# Altium schematic sheet DSP大板子.SchDoc (part 2 of 7)
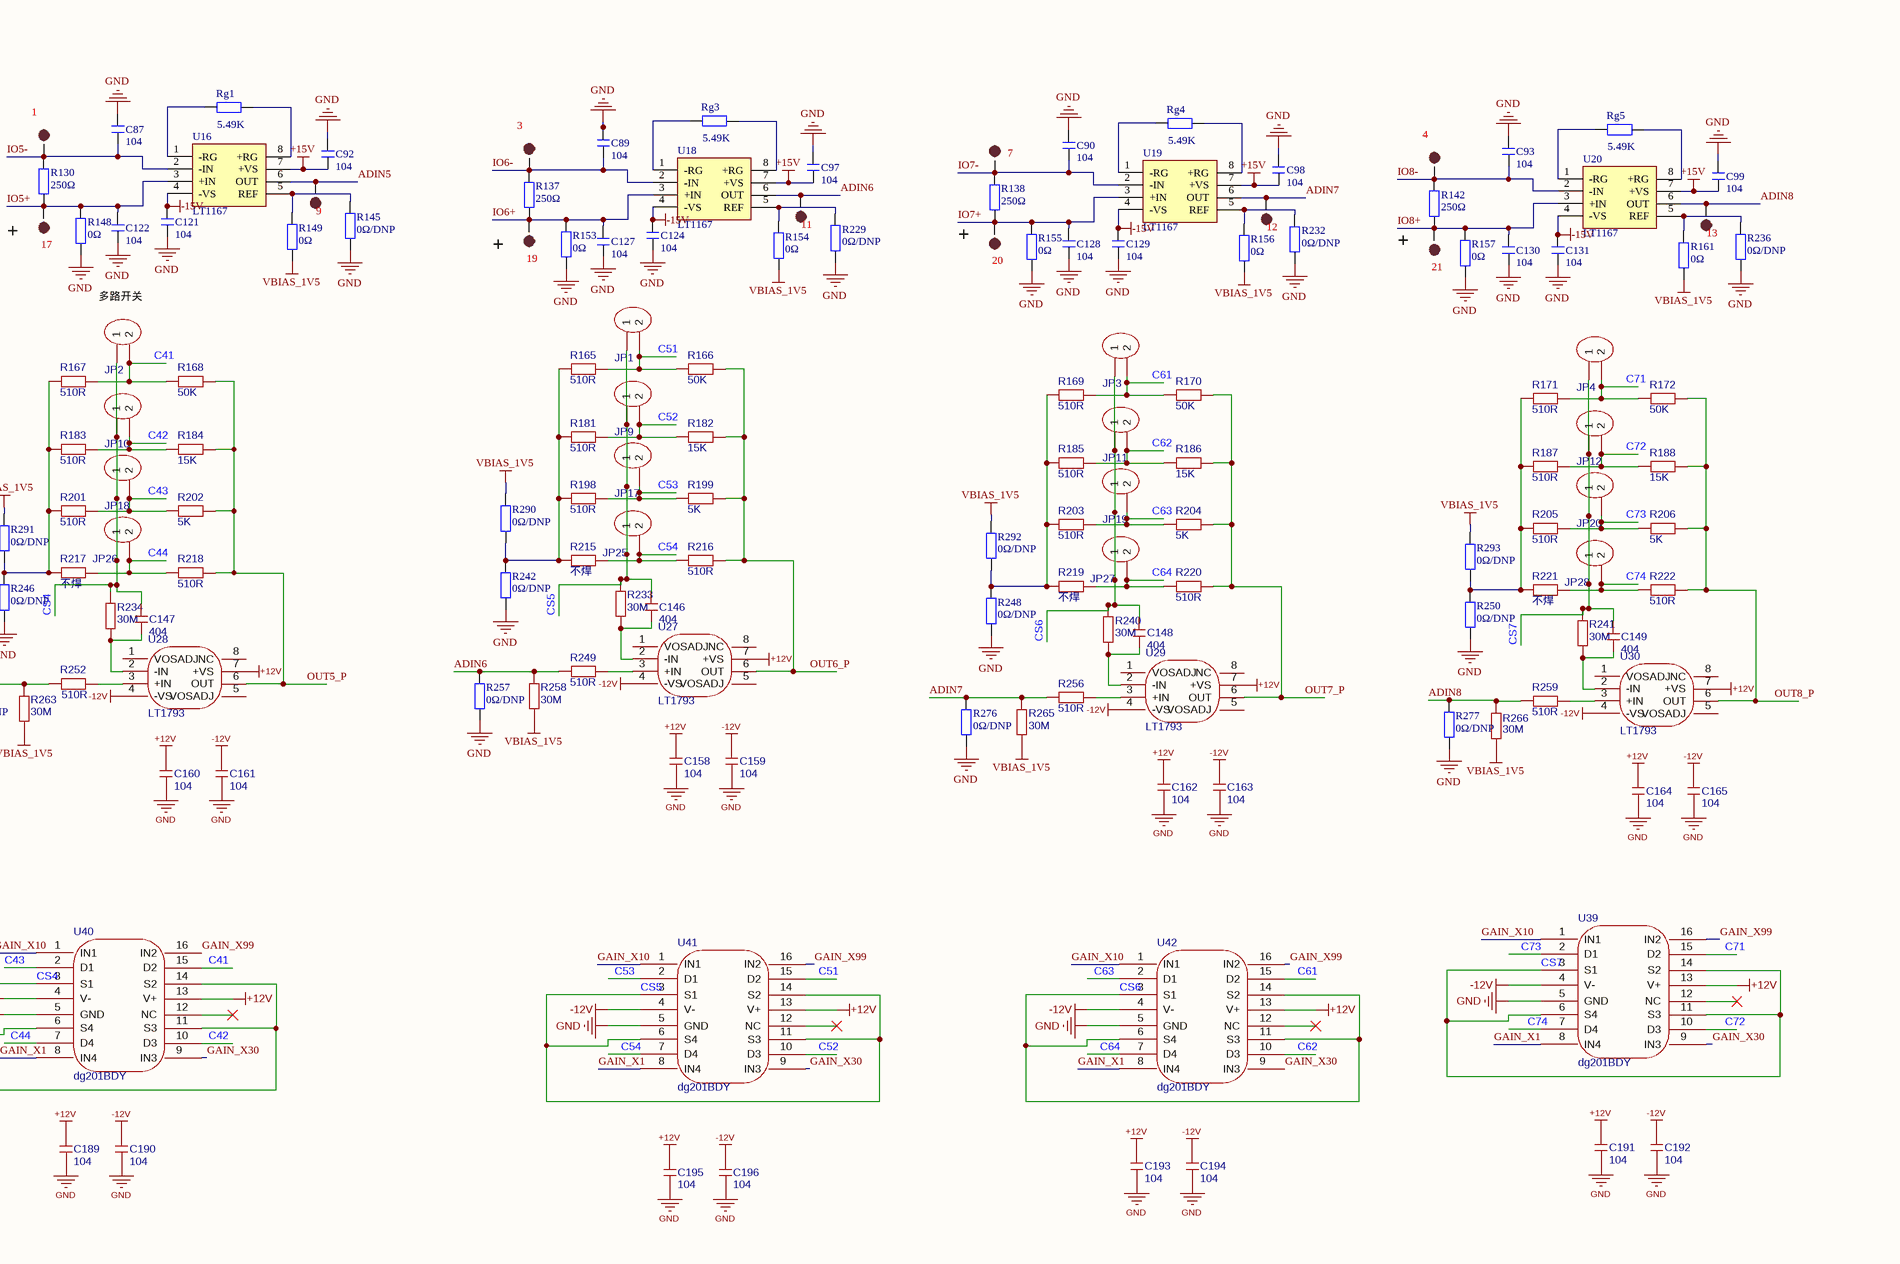
[diagram p6: DSP大板子.SchDoc, bottom right]
## Library data of the parts
1-24 +12 +15 -1 -12 -15 T1 = TEST-POINT: 测试点
BOOT1 = 5BIT DIP SOP Switch: Manufacturer: KE; Manufacturer PartNumber: DSWB05LHGET; Remark: 5位直插拨码开关 红色,2.54mm
C1 C17 C35 C36 C40 C76 C77 C87-C101 C107 C121 C122 C124-C137 = C: 贴片电容; BOM名称: 无极性贴片电容; 淘宝ID: 封装库来自淘宝 ID：黄晶宝石; 联系售后，技术支持: https://shop463601444.taobao.com; 唯一出售店铺网址: https://shop463601444.taobao.com
C2 C4 C5 C7-C9 C11 C13 C14 C16 C18 C19 C21 C26 C28 C30 C31 C34 C38 C39 C45 C46 C49-C51 C60-C62 C64 C66 C68 C71 C78 C79 C81 C86 C108-C111 C117-C119 C139 C143 C145 C154 C155 C157 C175 C180 C197-C200 = C: 无极性贴片电容; 版权归属: 源创客; BOM名称: 无极性贴片电容; 学习资源: www.ooocke.com
C3 C12 C20 C33 C41 C47 C53 C55 C67 = fs32x106k101egg: 容值:10uF;精度:±10%;额定电压:100V;温度系数:X7R;; Manufacturer: PSA(信昌电陶); AddInBom: yes; ModelId: 833068e7fe044595a6eec77c56179455; ModelName: C1210_L3.2-W2.5-H2.5; ModelTransform: 125.984,98.425,0,0,0,0,0,0,0; Tolerance: ±10%; Voltage Rating: 100V; Temperature Coefficient: X7R; Symbol: FS32X106K101EGG; LCSC Part Name: 10uF ±10% 100V; SupplierPart: C5156756; ManufacturerPart: FS32X106K101EGG; Supplier Footprint: 1210; JLCPCB Part Class: Extended Part; Datasheet: https://item.szlcsc.com/datasheet/FS32X106K101EGG/5791227.html; Supplier: LCSC; ConvertToPcb: yes; FootprintName: C1210; Value: 10uF
C6 C15 C25 C37 C44 C48 C59 C70 = fs32x106k101egg: 容值:10uF;精度:±10%;额定电压:100V;温度系数:X7R;; Manufacturer: PSA(信昌电陶); AddInBom: yes; ModelId: 833068e7fe044595a6eec77c56179455; ModelName: C1210_L3.2-W2.5-H2.5; ModelTransform: 125.984,98.425,0,0,0,0,0,0,0; Value: 10uF; Tolerance: ±10%; Voltage Rating: 100V; Temperature Coefficient: X7R; Symbol: FS32X106K101EGG; LCSC Part Name: 10uF ±10% 100V; SupplierPart: C5156756; ManufacturerPart: FS32X106K101EGG; Supplier Footprint: 1210; JLCPCB Part Class: Extended Part; Datasheet: https://item.szlcsc.com/datasheet/FS32X106K101EGG/5791227.html; Supplier: LCSC; ConvertToPcb: yes; FootprintName: C1210
C10 C29 C63 C80 = CAP_2
C22 C42 C54 C72 C82 C84 = CAP
C23 C32 C52 C65 = cl31b106kahnnne: 容值:10uF;精度:±10%;额定电压:25V;温度系数:X7R;; Manufacturer: SAMSUNG(三星); AddInBom: yes; ModelId: e4be705b945545a48e666415e3682bd8; ModelName: C1206_L3.2-W1.6-H1.3; ModelTransform: 125.984,62.992,0,0,0,0,0,0,0; Tolerance: ±10%; Voltage Rating: 25V; Temperature Coefficient: X7R; Symbol: CL31B106KAHNNNE; LCSC Part Name: 10uF ±10% 25V; SupplierPart: C14860; ManufacturerPart: CL31B106KAHNNNE; Supplier Footprint: 1206; JLCPCB Part Class: Extended Part; Datasheet: https://item.szlcsc.com/datasheet/CL31B106KAHNNNE/15532.html; Supplier: LCSC; ConvertToPcb: yes; FootprintName: C1206; Value: 10uF
C24 C27 C43 C56-C58 C73-C75 C83 C85 = Cap: Capacitor; Value: 104; Published: 8-Jun-2000; LatestRevisionDate: 17-Jul-2002; LatestRevisionNote: Re-released for DXP Platform.; Publisher: Altium Limited
C69 = cl31b106kahnnne: 容值:10uF;精度:±10%;额定电压:25V;温度系数:X7R;; Manufacturer: SAMSUNG(三星); AddInBom: yes; ModelId: e4be705b945545a48e666415e3682bd8; ModelName: C1206_L3.2-W1.6-H1.3; ModelTransform: 125.984,62.992,0,0,0,0,0,0,0; Value: 10uF; Tolerance: ±10%; Voltage Rating: 25V; Temperature Coefficient: X7R; Symbol: CL31B106KAHNNNE; LCSC Part Name: 10uF ±10% 25V; SupplierPart: C14860; ManufacturerPart: CL31B106KAHNNNE; Supplier Footprint: 1206; JLCPCB Part Class: Extended Part; Datasheet: https://item.szlcsc.com/datasheet/CL31B106KAHNNNE/15532.html; Supplier: LCSC; ConvertToPcb: yes; FootprintName: C1206
C102 = rxw470m1jbk-0811p: 容值:47uF;精度:±20%;额定电压:63V;纹波电流:405mA@100kHz;等效串联电阻(ESR):342mΩ@100kHz;; Manufacturer: Lelon(立隆); AddInBom: yes; ModelId: a2c936ec27754f809f3966430e36f767; ModelName: CAP-TH_D8.0-H8.0-P3.50; ModelTransform: 314.96,314.862,0,180,0,0,0,0,-137.795; Tolerance: ±20%; Voltage Rating: 63V; Pin Spacing: 3.5mm; Lifetime: 5000hrs@105℃; Symbol: RXW470M1JBK-0811P; LCSC Part Name: 47uF ±20% 63V; SupplierPart: C134656; ManufacturerPart: RXW470M1JBK-0811P; Supplier Footprint: 插件,D8xL11.5mm; JLCPCB Part Class: Extended Part; Datasheet: https://item.szlcsc.com/datasheet/RXW470M1JBK-0811P/145966.html; Supplier: LCSC; ConvertToPcb: yes; FootprintName: CAP-TH_BD8.0-P3.50-D0.6-FD; Value: 47uF; Ripple Current: 405mA@100kHz; Equivalent Series Resistance(ESR): 342mΩ@100kHz; Diameter: 8mm; Height - Seated (Max): 11.5mm
C103-C106 = fs32x225k101egg: 容值:2.2uF;精度:±10%;额定电压:100V;温度系数:X7R;; Manufacturer: PSA(信昌电陶); AddInBom: yes; ModelId: 833068e7fe044595a6eec77c56179455; ModelName: C1210_L3.2-W2.5-H2.5; ModelTransform: 125.984,98.425,0,0,0,0,0,0,0; Tolerance: ±10%; Voltage Rating: 100V; Temperature Coefficient: X7R; Symbol: FS32X225K101EGG; LCSC Part Name: 2.2uF ±10% 100V; SupplierPart: C153036; ManufacturerPart: FS32X225K101EGG; Supplier Footprint: 1210; JLCPCB Part Class: Extended Part; Datasheet: https://item.szlcsc.com/datasheet/FS32X225K101EGG/164378.html; Supplier: LCSC; ConvertToPcb: yes; FootprintName: C1210; Value: 2.2uF
C112 C123 = 100yxj10m6.3x11: 容值:10uF;精度:±20%;额定电压:100V;纹波电流:112.14mA@120Hz;等效串联电阻(ESR):570mΩ;; Manufacturer: Rubycon(红宝石); AddInBom: yes; ModelId: 3cdd55eab6a840dba93006d5a727d063; ModelTransform: 247.778,247.90446,0,0,0,0,0,0,-137.795; Tolerance: ±20%; Voltage Rating: 100V; Equivalent Series Resistance(ESR): 570mΩ; Pin Spacing: 2.5mm; Lifetime: 7000hrs@105℃; Symbol: 100YXJ10M6.3X11; LCSC Part Name: 10uF ±20% 100V; SupplierPart: C1668981; ManufacturerPart: 100YXJ10M6.3X11; Supplier Footprint: 插件,D6.3xL11mm; JLCPCB Part Class: Extended Part; Supplier: LCSC; ConvertToPcb: yes; FootprintName: CAP-TH_BD6.3-P2.50-D0.6-FD; ModelName: CAP-TH_BD6.3-P2.50-D0.6-FD; Value: 10uF; Ripple Current: 112.14mA@120Hz; Diameter: 6.3mm; Height - Seated (Max): 11mm; Operating Temperature: -40℃~+105℃
C113 C120 C156 = eeufr1h101: 容值:100uF;精度:±20%;额定电压:50V;纹波电流:870mA@100kHz;等效串联电阻(ESR):61mΩ@100kHz;; Manufacturer: PANASONIC(松下); AddInBom: yes; ModelId: 5fc21599cab34df2ad7753b19b2f5286; ModelTransform: 315.365,314.914,0,0,0,0,0,0,-196.85; Tolerance: ±20%; Voltage Rating: 50V; Pin Spacing: 3.5mm; Lifetime: 6000hrs@105℃; Polarity type: 有极性; Symbol: EEUFR1H101; LCSC Part Name: 100uF ±20% 50V; SupplierPart: C178702; ManufacturerPart: EEUFR1H101; Supplier Footprint: 插件,D8xL11.5mm; JLCPCB Part Class: Extended Part; Datasheet: https://item.szlcsc.com/datasheet/EEUFR1H101/190095.html; Supplier: LCSC; ConvertToPcb: yes; FootprintName: CAP-TH_BD8.0-P3.50-D0.6-FD_1; ModelName: CAP-TH_BD8.0-P3.50-D0.6-FD_1; Value: 100uF; Ripple Current: 870mA@100kHz; Equivalent Series Resistance(ESR): 61mΩ@100kHz; Diameter: 8mm; Height - Seated (Max): 11.5mm; Operating Temperature: -40℃~+105℃
C114-C116 = fs32x225k101egg: 容值:2.2uF;精度:±10%;额定电压:100V;温度系数:X7R;; Manufacturer: PSA(信昌电陶); AddInBom: yes; ModelId: 833068e7fe044595a6eec77c56179455; ModelName: C1210_L3.2-W2.5-H2.5; ModelTransform: 125.984,98.425,0,0,0,0,0,0,0; Value: 2.2uF; Tolerance: ±10%; Voltage Rating: 100V; Temperature Coefficient: X7R; Symbol: FS32X225K101EGG; LCSC Part Name: 2.2uF ±10% 100V; SupplierPart: C153036; ManufacturerPart: FS32X225K101EGG; Supplier Footprint: 1210; JLCPCB Part Class: Extended Part; Datasheet: https://item.szlcsc.com/datasheet/FS32X225K101EGG/164378.html; Supplier: LCSC; ConvertToPcb: yes; FootprintName: C1210
C138 = CAP: 100µF/63V
C140 C141 = CAP: 10µF/25V
C142 C144 = CAP: 47µF/25V
C146 = C: 贴片电容; BOM名称: 无极性贴片电容; 淘宝ID: 封装库来自淘宝 ID：黄晶宝石; Origin Footprint: C 0201_L; OriginFootprint 2: C 0402_L; OriginFootprint 3: C 0805_L; OriginFootprint 4: C 1206_L; OriginFootprint 5: C 1210_L; OriginFootprint 6: C 1808_L; OriginFootprint 7: C 1812_L; OriginFootprint 8: C 1825_L; OriginFootprint 9: C 2225_L; OriginFootprint 10: C 0201_M; OriginFootprint 11: C 0402_M; OriginFootprint 12: C 0603_M; OriginFootprint 13: C 0805_M; OriginFootprint 14: C 1206_M; OriginFootprint 15: C 1210_M; OriginFootprint 16: C 1808_M; OriginFootprint 17: C 1812_M; OriginFootprint 18: C 1825_M; OriginFootprint 19: C 2225_M; UniqueId: 2b2365c2d0e3ae99; AddInBom: yes; OriginModelName: C 0603; Device: C; 联系售后，技术支持: https://shop463601444.taobao.com; 唯一出售店铺网址: https://shop463601444.taobao.com; DesignItemID: C; LibraryName: 0.1 - 电阻-电容-电感; SymbolName: C; FootprintName: C 0603_L
C147 = C: 贴片电容; BOM名称: 无极性贴片电容; 淘宝ID: 封装库来自淘宝 ID：黄晶宝石; Origin Footprint: C 0201_L; OriginFootprint 2: C 0402_L; OriginFootprint 3: C 0805_L; OriginFootprint 4: C 1206_L; OriginFootprint 5: C 1210_L; OriginFootprint 6: C 1808_L; OriginFootprint 7: C 1812_L; OriginFootprint 8: C 1825_L; OriginFootprint 9: C 2225_L; OriginFootprint 10: C 0201_M; OriginFootprint 11: C 0402_M; OriginFootprint 12: C 0603_M; OriginFootprint 13: C 0805_M; OriginFootprint 14: C 1206_M; OriginFootprint 15: C 1210_M; OriginFootprint 16: C 1808_M; OriginFootprint 17: C 1812_M; OriginFootprint 18: C 1825_M; OriginFootprint 19: C 2225_M; UniqueId: 2ac4a713bdb27458; AddInBom: yes; OriginModelName: C 0603; Device: C; 联系售后，技术支持: https://shop463601444.taobao.com; 唯一出售店铺网址: https://shop463601444.taobao.com; DesignItemID: C; LibraryName: 0.1 - 电阻-电容-电感; SymbolName: C; FootprintName: C 0603_L
C148 = C: 贴片电容; BOM名称: 无极性贴片电容; 淘宝ID: 封装库来自淘宝 ID：黄晶宝石; Origin Footprint: C 0201_L; OriginFootprint 2: C 0402_L; OriginFootprint 3: C 0805_L; OriginFootprint 4: C 1206_L; OriginFootprint 5: C 1210_L; OriginFootprint 6: C 1808_L; OriginFootprint 7: C 1812_L; OriginFootprint 8: C 1825_L; OriginFootprint 9: C 2225_L; OriginFootprint 10: C 0201_M; OriginFootprint 11: C 0402_M; OriginFootprint 12: C 0603_M; OriginFootprint 13: C 0805_M; OriginFootprint 14: C 1206_M; OriginFootprint 15: C 1210_M; OriginFootprint 16: C 1808_M; OriginFootprint 17: C 1812_M; OriginFootprint 18: C 1825_M; OriginFootprint 19: C 2225_M; UniqueId: 043006a40a259ae3; AddInBom: yes; OriginModelName: C 0603; Device: C; 联系售后，技术支持: https://shop463601444.taobao.com; 唯一出售店铺网址: https://shop463601444.taobao.com; DesignItemID: C; LibraryName: 0.1 - 电阻-电容-电感; SymbolName: C; FootprintName: C 0603_L
C149 = C: 贴片电容; BOM名称: 无极性贴片电容; 淘宝ID: 封装库来自淘宝 ID：黄晶宝石; Origin Footprint: C 0201_L; OriginFootprint 2: C 0402_L; OriginFootprint 3: C 0805_L; OriginFootprint 4: C 1206_L; OriginFootprint 5: C 1210_L; OriginFootprint 6: C 1808_L; OriginFootprint 7: C 1812_L; OriginFootprint 8: C 1825_L; OriginFootprint 9: C 2225_L; OriginFootprint 10: C 0201_M; OriginFootprint 11: C 0402_M; OriginFootprint 12: C 0603_M; OriginFootprint 13: C 0805_M; OriginFootprint 14: C 1206_M; OriginFootprint 15: C 1210_M; OriginFootprint 16: C 1808_M; OriginFootprint 17: C 1812_M; OriginFootprint 18: C 1825_M; OriginFootprint 19: C 2225_M; UniqueId: ed052c5890e059ff; AddInBom: yes; OriginModelName: C 0603; Device: C; 联系售后，技术支持: https://shop463601444.taobao.com; 唯一出售店铺网址: https://shop463601444.taobao.com; DesignItemID: C; LibraryName: 0.1 - 电阻-电容-电感; SymbolName: C; FootprintName: C 0603_L
C150 = C: 贴片电容; BOM名称: 无极性贴片电容; 淘宝ID: 封装库来自淘宝 ID：黄晶宝石; Origin Footprint: C 0201_L; OriginFootprint 2: C 0402_L; OriginFootprint 3: C 0805_L; OriginFootprint 4: C 1206_L; OriginFootprint 5: C 1210_L; OriginFootprint 6: C 1808_L; OriginFootprint 7: C 1812_L; OriginFootprint 8: C 1825_L; OriginFootprint 9: C 2225_L; OriginFootprint 10: C 0201_M; OriginFootprint 11: C 0402_M; OriginFootprint 12: C 0603_M; OriginFootprint 13: C 0805_M; OriginFootprint 14: C 1206_M; OriginFootprint 15: C 1210_M; OriginFootprint 16: C 1808_M; OriginFootprint 17: C 1812_M; OriginFootprint 18: C 1825_M; OriginFootprint 19: C 2225_M; UniqueId: e3aeb17489c0ab5d; AddInBom: yes; OriginModelName: C 0603; Device: C; 联系售后，技术支持: https://shop463601444.taobao.com; 唯一出售店铺网址: https://shop463601444.taobao.com; DesignItemID: C; LibraryName: 0.1 - 电阻-电容-电感; SymbolName: C; FootprintName: C 0603_L
C151 = C: 贴片电容; BOM名称: 无极性贴片电容; 淘宝ID: 封装库来自淘宝 ID：黄晶宝石; Origin Footprint: C 0201_L; OriginFootprint 2: C 0402_L; OriginFootprint 3: C 0805_L; OriginFootprint 4: C 1206_L; OriginFootprint 5: C 1210_L; OriginFootprint 6: C 1808_L; OriginFootprint 7: C 1812_L; OriginFootprint 8: C 1825_L; OriginFootprint 9: C 2225_L; OriginFootprint 10: C 0201_M; OriginFootprint 11: C 0402_M; OriginFootprint 12: C 0603_M; OriginFootprint 13: C 0805_M; OriginFootprint 14: C 1206_M; OriginFootprint 15: C 1210_M; OriginFootprint 16: C 1808_M; OriginFootprint 17: C 1812_M; OriginFootprint 18: C 1825_M; OriginFootprint 19: C 2225_M; UniqueId: cc1d00c51cc12124; AddInBom: yes; OriginModelName: C 0603; Device: C; 联系售后，技术支持: https://shop463601444.taobao.com; 唯一出售店铺网址: https://shop463601444.taobao.com; DesignItemID: C; LibraryName: 0.1 - 电阻-电容-电感; SymbolName: C; FootprintName: C 0603_L
C152 = C: 贴片电容; BOM名称: 无极性贴片电容; 淘宝ID: 封装库来自淘宝 ID：黄晶宝石; Origin Footprint: C 0201_L; OriginFootprint 2: C 0402_L; OriginFootprint 3: C 0805_L; OriginFootprint 4: C 1206_L; OriginFootprint 5: C 1210_L; OriginFootprint 6: C 1808_L; OriginFootprint 7: C 1812_L; OriginFootprint 8: C 1825_L; OriginFootprint 9: C 2225_L; OriginFootprint 10: C 0201_M; OriginFootprint 11: C 0402_M; OriginFootprint 12: C 0603_M; OriginFootprint 13: C 0805_M; OriginFootprint 14: C 1206_M; OriginFootprint 15: C 1210_M; OriginFootprint 16: C 1808_M; OriginFootprint 17: C 1812_M; OriginFootprint 18: C 1825_M; OriginFootprint 19: C 2225_M; UniqueId: d2625f4b4bd439ef; AddInBom: yes; OriginModelName: C 0603; Device: C; 联系售后，技术支持: https://shop463601444.taobao.com; 唯一出售店铺网址: https://shop463601444.taobao.com; DesignItemID: C; LibraryName: 0.1 - 电阻-电容-电感; SymbolName: C; FootprintName: C 0603_L
C153 = C: 贴片电容; BOM名称: 无极性贴片电容; 淘宝ID: 封装库来自淘宝 ID：黄晶宝石; Origin Footprint: C 0201_L; OriginFootprint 2: C 0402_L; OriginFootprint 3: C 0805_L; OriginFootprint 4: C 1206_L; OriginFootprint 5: C 1210_L; OriginFootprint 6: C 1808_L; OriginFootprint 7: C 1812_L; OriginFootprint 8: C 1825_L; OriginFootprint 9: C 2225_L; OriginFootprint 10: C 0201_M; OriginFootprint 11: C 0402_M; OriginFootprint 12: C 0603_M; OriginFootprint 13: C 0805_M; OriginFootprint 14: C 1206_M; OriginFootprint 15: C 1210_M; OriginFootprint 16: C 1808_M; OriginFootprint 17: C 1812_M; OriginFootprint 18: C 1825_M; OriginFootprint 19: C 2225_M; UniqueId: a26eb100929f0697; AddInBom: yes; OriginModelName: C 0603; Device: C; 联系售后，技术支持: https://shop463601444.taobao.com; 唯一出售店铺网址: https://shop463601444.taobao.com; DesignItemID: C; LibraryName: 0.1 - 电阻-电容-电感; SymbolName: C; FootprintName: C 0603_L
C158 = C: 贴片电容; BOM名称: 无极性贴片电容; 淘宝ID: 封装库来自淘宝 ID：黄晶宝石; Origin Footprint: C 0201_L; OriginFootprint 2: C 0402_L; OriginFootprint 3: C 0805_L; OriginFootprint 4: C 1206_L; OriginFootprint 5: C 1210_L; OriginFootprint 6: C 1808_L; OriginFootprint 7: C 1812_L; OriginFootprint 8: C 1825_L; OriginFootprint 9: C 2225_L; OriginFootprint 10: C 0201_M; OriginFootprint 11: C 0402_M; OriginFootprint 12: C 0603_M; OriginFootprint 13: C 0805_M; OriginFootprint 14: C 1206_M; OriginFootprint 15: C 1210_M; OriginFootprint 16: C 1808_M; OriginFootprint 17: C 1812_M; OriginFootprint 18: C 1825_M; OriginFootprint 19: C 2225_M; UniqueId: 6158349470ed1956; AddInBom: yes; OriginModelName: C 0603; Device: C; 联系售后，技术支持: https://shop463601444.taobao.com; 唯一出售店铺网址: https://shop463601444.taobao.com; DesignItemID: C; LibraryName: 0.1 - 电阻-电容-电感; SymbolName: C; FootprintName: C 0603_L
C159 = C: 贴片电容; BOM名称: 无极性贴片电容; 淘宝ID: 封装库来自淘宝 ID：黄晶宝石; Origin Footprint: C 0201_L; OriginFootprint 2: C 0402_L; OriginFootprint 3: C 0805_L; OriginFootprint 4: C 1206_L; OriginFootprint 5: C 1210_L; OriginFootprint 6: C 1808_L; OriginFootprint 7: C 1812_L; OriginFootprint 8: C 1825_L; OriginFootprint 9: C 2225_L; OriginFootprint 10: C 0201_M; OriginFootprint 11: C 0402_M; OriginFootprint 12: C 0603_M; OriginFootprint 13: C 0805_M; OriginFootprint 14: C 1206_M; OriginFootprint 15: C 1210_M; OriginFootprint 16: C 1808_M; OriginFootprint 17: C 1812_M; OriginFootprint 18: C 1825_M; OriginFootprint 19: C 2225_M; UniqueId: de488198406d19e5; AddInBom: yes; OriginModelName: C 0603; Device: C; 联系售后，技术支持: https://shop463601444.taobao.com; 唯一出售店铺网址: https://shop463601444.taobao.com; DesignItemID: C; LibraryName: 0.1 - 电阻-电容-电感; SymbolName: C; FootprintName: C 0603_L
C160 = C: 贴片电容; BOM名称: 无极性贴片电容; 淘宝ID: 封装库来自淘宝 ID：黄晶宝石; Origin Footprint: C 0201_L; OriginFootprint 2: C 0402_L; OriginFootprint 3: C 0805_L; OriginFootprint 4: C 1206_L; OriginFootprint 5: C 1210_L; OriginFootprint 6: C 1808_L; OriginFootprint 7: C 1812_L; OriginFootprint 8: C 1825_L; OriginFootprint 9: C 2225_L; OriginFootprint 10: C 0201_M; OriginFootprint 11: C 0402_M; OriginFootprint 12: C 0603_M; OriginFootprint 13: C 0805_M; OriginFootprint 14: C 1206_M; OriginFootprint 15: C 1210_M; OriginFootprint 16: C 1808_M; OriginFootprint 17: C 1812_M; OriginFootprint 18: C 1825_M; OriginFootprint 19: C 2225_M; UniqueId: ac7cf9eb5671d2c3; AddInBom: yes; OriginModelName: C 0603; Device: C; 联系售后，技术支持: https://shop463601444.taobao.com; 唯一出售店铺网址: https://shop463601444.taobao.com; DesignItemID: C; LibraryName: 0.1 - 电阻-电容-电感; SymbolName: C; FootprintName: C 0603_L
C161 = C: 贴片电容; BOM名称: 无极性贴片电容; 淘宝ID: 封装库来自淘宝 ID：黄晶宝石; Origin Footprint: C 0201_L; OriginFootprint 2: C 0402_L; OriginFootprint 3: C 0805_L; OriginFootprint 4: C 1206_L; OriginFootprint 5: C 1210_L; OriginFootprint 6: C 1808_L; OriginFootprint 7: C 1812_L; OriginFootprint 8: C 1825_L; OriginFootprint 9: C 2225_L; OriginFootprint 10: C 0201_M; OriginFootprint 11: C 0402_M; OriginFootprint 12: C 0603_M; OriginFootprint 13: C 0805_M; OriginFootprint 14: C 1206_M; OriginFootprint 15: C 1210_M; OriginFootprint 16: C 1808_M; OriginFootprint 17: C 1812_M; OriginFootprint 18: C 1825_M; OriginFootprint 19: C 2225_M; UniqueId: 5471cb5e6ead650e; AddInBom: yes; OriginModelName: C 0603; Device: C; 联系售后，技术支持: https://shop463601444.taobao.com; 唯一出售店铺网址: https://shop463601444.taobao.com; DesignItemID: C; LibraryName: 0.1 - 电阻-电容-电感; SymbolName: C; FootprintName: C 0603_L
C162 = C: 贴片电容; BOM名称: 无极性贴片电容; 淘宝ID: 封装库来自淘宝 ID：黄晶宝石; Origin Footprint: C 0201_L; OriginFootprint 2: C 0402_L; OriginFootprint 3: C 0805_L; OriginFootprint 4: C 1206_L; OriginFootprint 5: C 1210_L; OriginFootprint 6: C 1808_L; OriginFootprint 7: C 1812_L; OriginFootprint 8: C 1825_L; OriginFootprint 9: C 2225_L; OriginFootprint 10: C 0201_M; OriginFootprint 11: C 0402_M; OriginFootprint 12: C 0603_M; OriginFootprint 13: C 0805_M; OriginFootprint 14: C 1206_M; OriginFootprint 15: C 1210_M; OriginFootprint 16: C 1808_M; OriginFootprint 17: C 1812_M; OriginFootprint 18: C 1825_M; OriginFootprint 19: C 2225_M; UniqueId: 909660952e1a96fd; AddInBom: yes; OriginModelName: C 0603; Device: C; 联系售后，技术支持: https://shop463601444.taobao.com; 唯一出售店铺网址: https://shop463601444.taobao.com; DesignItemID: C; LibraryName: 0.1 - 电阻-电容-电感; SymbolName: C; FootprintName: C 0603_L
C163 = C: 贴片电容; BOM名称: 无极性贴片电容; 淘宝ID: 封装库来自淘宝 ID：黄晶宝石; Origin Footprint: C 0201_L; OriginFootprint 2: C 0402_L; OriginFootprint 3: C 0805_L; OriginFootprint 4: C 1206_L; OriginFootprint 5: C 1210_L; OriginFootprint 6: C 1808_L; OriginFootprint 7: C 1812_L; OriginFootprint 8: C 1825_L; OriginFootprint 9: C 2225_L; OriginFootprint 10: C 0201_M; OriginFootprint 11: C 0402_M; OriginFootprint 12: C 0603_M; OriginFootprint 13: C 0805_M; OriginFootprint 14: C 1206_M; OriginFootprint 15: C 1210_M; OriginFootprint 16: C 1808_M; OriginFootprint 17: C 1812_M; OriginFootprint 18: C 1825_M; OriginFootprint 19: C 2225_M; UniqueId: 7abe426619a81940; AddInBom: yes; OriginModelName: C 0603; Device: C; 联系售后，技术支持: https://shop463601444.taobao.com; 唯一出售店铺网址: https://shop463601444.taobao.com; DesignItemID: C; LibraryName: 0.1 - 电阻-电容-电感; SymbolName: C; FootprintName: C 0603_L
C164 = C: 贴片电容; BOM名称: 无极性贴片电容; 淘宝ID: 封装库来自淘宝 ID：黄晶宝石; Origin Footprint: C 0201_L; OriginFootprint 2: C 0402_L; OriginFootprint 3: C 0805_L; OriginFootprint 4: C 1206_L; OriginFootprint 5: C 1210_L; OriginFootprint 6: C 1808_L; OriginFootprint 7: C 1812_L; OriginFootprint 8: C 1825_L; OriginFootprint 9: C 2225_L; OriginFootprint 10: C 0201_M; OriginFootprint 11: C 0402_M; OriginFootprint 12: C 0603_M; OriginFootprint 13: C 0805_M; OriginFootprint 14: C 1206_M; OriginFootprint 15: C 1210_M; OriginFootprint 16: C 1808_M; OriginFootprint 17: C 1812_M; OriginFootprint 18: C 1825_M; OriginFootprint 19: C 2225_M; UniqueId: f9bfd7a6531d354d; AddInBom: yes; OriginModelName: C 0603; Device: C; 联系售后，技术支持: https://shop463601444.taobao.com; 唯一出售店铺网址: https://shop463601444.taobao.com; DesignItemID: C; LibraryName: 0.1 - 电阻-电容-电感; SymbolName: C; FootprintName: C 0603_L
C165 = C: 贴片电容; BOM名称: 无极性贴片电容; 淘宝ID: 封装库来自淘宝 ID：黄晶宝石; Origin Footprint: C 0201_L; OriginFootprint 2: C 0402_L; OriginFootprint 3: C 0805_L; OriginFootprint 4: C 1206_L; OriginFootprint 5: C 1210_L; OriginFootprint 6: C 1808_L; OriginFootprint 7: C 1812_L; OriginFootprint 8: C 1825_L; OriginFootprint 9: C 2225_L; OriginFootprint 10: C 0201_M; OriginFootprint 11: C 0402_M; OriginFootprint 12: C 0603_M; OriginFootprint 13: C 0805_M; OriginFootprint 14: C 1206_M; OriginFootprint 15: C 1210_M; OriginFootprint 16: C 1808_M; OriginFootprint 17: C 1812_M; OriginFootprint 18: C 1825_M; OriginFootprint 19: C 2225_M; UniqueId: ecf0d2211b923647; AddInBom: yes; OriginModelName: C 0603; Device: C; 联系售后，技术支持: https://shop463601444.taobao.com; 唯一出售店铺网址: https://shop463601444.taobao.com; DesignItemID: C; LibraryName: 0.1 - 电阻-电容-电感; SymbolName: C; FootprintName: C 0603_L
C166 = C: 贴片电容; BOM名称: 无极性贴片电容; 淘宝ID: 封装库来自淘宝 ID：黄晶宝石; Origin Footprint: C 0201_L; OriginFootprint 2: C 0402_L; OriginFootprint 3: C 0805_L; OriginFootprint 4: C 1206_L; OriginFootprint 5: C 1210_L; OriginFootprint 6: C 1808_L; OriginFootprint 7: C 1812_L; OriginFootprint 8: C 1825_L; OriginFootprint 9: C 2225_L; OriginFootprint 10: C 0201_M; OriginFootprint 11: C 0402_M; OriginFootprint 12: C 0603_M; OriginFootprint 13: C 0805_M; OriginFootprint 14: C 1206_M; OriginFootprint 15: C 1210_M; OriginFootprint 16: C 1808_M; OriginFootprint 17: C 1812_M; OriginFootprint 18: C 1825_M; OriginFootprint 19: C 2225_M; UniqueId: a2ee6ceb65d30336; AddInBom: yes; OriginModelName: C 0603; Device: C; 联系售后，技术支持: https://shop463601444.taobao.com; 唯一出售店铺网址: https://shop463601444.taobao.com; DesignItemID: C; LibraryName: 0.1 - 电阻-电容-电感; SymbolName: C; FootprintName: C 0603_L
C167 = C: 贴片电容; BOM名称: 无极性贴片电容; 淘宝ID: 封装库来自淘宝 ID：黄晶宝石; Origin Footprint: C 0201_L; OriginFootprint 2: C 0402_L; OriginFootprint 3: C 0805_L; OriginFootprint 4: C 1206_L; OriginFootprint 5: C 1210_L; OriginFootprint 6: C 1808_L; OriginFootprint 7: C 1812_L; OriginFootprint 8: C 1825_L; OriginFootprint 9: C 2225_L; OriginFootprint 10: C 0201_M; OriginFootprint 11: C 0402_M; OriginFootprint 12: C 0603_M; OriginFootprint 13: C 0805_M; OriginFootprint 14: C 1206_M; OriginFootprint 15: C 1210_M; OriginFootprint 16: C 1808_M; OriginFootprint 17: C 1812_M; OriginFootprint 18: C 1825_M; OriginFootprint 19: C 2225_M; UniqueId: ff078052695da6b6; AddInBom: yes; OriginModelName: C 0603; Device: C; 联系售后，技术支持: https://shop463601444.taobao.com; 唯一出售店铺网址: https://shop463601444.taobao.com; DesignItemID: C; LibraryName: 0.1 - 电阻-电容-电感; SymbolName: C; FootprintName: C 0603_L
C168 = C: 贴片电容; BOM名称: 无极性贴片电容; 淘宝ID: 封装库来自淘宝 ID：黄晶宝石; Origin Footprint: C 0201_L; OriginFootprint 2: C 0402_L; OriginFootprint 3: C 0805_L; OriginFootprint 4: C 1206_L; OriginFootprint 5: C 1210_L; OriginFootprint 6: C 1808_L; OriginFootprint 7: C 1812_L; OriginFootprint 8: C 1825_L; OriginFootprint 9: C 2225_L; OriginFootprint 10: C 0201_M; OriginFootprint 11: C 0402_M; OriginFootprint 12: C 0603_M; OriginFootprint 13: C 0805_M; OriginFootprint 14: C 1206_M; OriginFootprint 15: C 1210_M; OriginFootprint 16: C 1808_M; OriginFootprint 17: C 1812_M; OriginFootprint 18: C 1825_M; OriginFootprint 19: C 2225_M; UniqueId: 553def7d7947fca6; AddInBom: yes; OriginModelName: C 0603; Device: C; 联系售后，技术支持: https://shop463601444.taobao.com; 唯一出售店铺网址: https://shop463601444.taobao.com; DesignItemID: C; LibraryName: 0.1 - 电阻-电容-电感; SymbolName: C; FootprintName: C 0603_L
C169 = C: 贴片电容; BOM名称: 无极性贴片电容; 淘宝ID: 封装库来自淘宝 ID：黄晶宝石; Origin Footprint: C 0201_L; OriginFootprint 2: C 0402_L; OriginFootprint 3: C 0805_L; OriginFootprint 4: C 1206_L; OriginFootprint 5: C 1210_L; OriginFootprint 6: C 1808_L; OriginFootprint 7: C 1812_L; OriginFootprint 8: C 1825_L; OriginFootprint 9: C 2225_L; OriginFootprint 10: C 0201_M; OriginFootprint 11: C 0402_M; OriginFootprint 12: C 0603_M; OriginFootprint 13: C 0805_M; OriginFootprint 14: C 1206_M; OriginFootprint 15: C 1210_M; OriginFootprint 16: C 1808_M; OriginFootprint 17: C 1812_M; OriginFootprint 18: C 1825_M; OriginFootprint 19: C 2225_M; UniqueId: 54d3d224326b3f8f; AddInBom: yes; OriginModelName: C 0603; Device: C; 联系售后，技术支持: https://shop463601444.taobao.com; 唯一出售店铺网址: https://shop463601444.taobao.com; DesignItemID: C; LibraryName: 0.1 - 电阻-电容-电感; SymbolName: C; FootprintName: C 0603_L
C170 = C: 贴片电容; BOM名称: 无极性贴片电容; 淘宝ID: 封装库来自淘宝 ID：黄晶宝石; Origin Footprint: C 0201_L; OriginFootprint 2: C 0402_L; OriginFootprint 3: C 0805_L; OriginFootprint 4: C 1206_L; OriginFootprint 5: C 1210_L; OriginFootprint 6: C 1808_L; OriginFootprint 7: C 1812_L; OriginFootprint 8: C 1825_L; OriginFootprint 9: C 2225_L; OriginFootprint 10: C 0201_M; OriginFootprint 11: C 0402_M; OriginFootprint 12: C 0603_M; OriginFootprint 13: C 0805_M; OriginFootprint 14: C 1206_M; OriginFootprint 15: C 1210_M; OriginFootprint 16: C 1808_M; OriginFootprint 17: C 1812_M; OriginFootprint 18: C 1825_M; OriginFootprint 19: C 2225_M; UniqueId: 2b4e6e580c7acde0; AddInBom: yes; OriginModelName: C 0603; Device: C; 联系售后，技术支持: https://shop463601444.taobao.com; 唯一出售店铺网址: https://shop463601444.taobao.com; DesignItemID: C; LibraryName: 0.1 - 电阻-电容-电感; SymbolName: C; FootprintName: C 0603_L
C171 = C: 贴片电容; BOM名称: 无极性贴片电容; 淘宝ID: 封装库来自淘宝 ID：黄晶宝石; Origin Footprint: C 0201_L; OriginFootprint 2: C 0402_L; OriginFootprint 3: C 0805_L; OriginFootprint 4: C 1206_L; OriginFootprint 5: C 1210_L; OriginFootprint 6: C 1808_L; OriginFootprint 7: C 1812_L; OriginFootprint 8: C 1825_L; OriginFootprint 9: C 2225_L; OriginFootprint 10: C 0201_M; OriginFootprint 11: C 0402_M; OriginFootprint 12: C 0603_M; OriginFootprint 13: C 0805_M; OriginFootprint 14: C 1206_M; OriginFootprint 15: C 1210_M; OriginFootprint 16: C 1808_M; OriginFootprint 17: C 1812_M; OriginFootprint 18: C 1825_M; OriginFootprint 19: C 2225_M; UniqueId: 12af2948e5a85261; AddInBom: yes; OriginModelName: C 0603; Device: C; 联系售后，技术支持: https://shop463601444.taobao.com; 唯一出售店铺网址: https://shop463601444.taobao.com; DesignItemID: C; LibraryName: 0.1 - 电阻-电容-电感; SymbolName: C; FootprintName: C 0603_L
C172 = cl31b475kbhnnne: 容值:4.7uF;精度:±10%;额定电压:50V;温度系数:X7R;; Manufacturer: SAMSUNG(三星); AddInBom: yes; ModelId: e4be705b945545a48e666415e3682bd8; ModelName: C1206_L3.2-W1.6-H1.3; ModelTransform: 125.984,62.992,0,0,0,0,0,0,0; Tolerance: ±10%; Voltage Rating: 50V; Temperature Coefficient: X7R; Symbol: CL31B475KBHNNNE; LCSC Part Name: 4.7uF ±10% 50V; SupplierPart: C51205; ManufacturerPart: CL31B475KBHNNNE; Supplier Footprint: 1206; JLCPCB Part Class: Extended Part; Datasheet: https://item.szlcsc.com/datasheet/CL31B475KBHNNNE/52218.html; Supplier: LCSC; ConvertToPcb: yes; FootprintName: C1206; Value: 4.7uF
C173 = C: 贴片电容; BOM名称: 无极性贴片电容; 淘宝ID: 封装库来自淘宝 ID：黄晶宝石; Origin Footprint: C 0201_L; OriginFootprint 2: C 0402_L; OriginFootprint 3: C 0805_L; OriginFootprint 4: C 1206_L; OriginFootprint 5: C 1210_L; OriginFootprint 6: C 1808_L; OriginFootprint 7: C 1812_L; OriginFootprint 8: C 1825_L; OriginFootprint 9: C 2225_L; OriginFootprint 10: C 0201_M; OriginFootprint 11: C 0402_M; OriginFootprint 12: C 0603_M; OriginFootprint 13: C 0805_M; OriginFootprint 14: C 1206_M; OriginFootprint 15: C 1210_M; OriginFootprint 16: C 1808_M; OriginFootprint 17: C 1812_M; OriginFootprint 18: C 1825_M; OriginFootprint 19: C 2225_M; UniqueId: 5bfcee5f0e3d202c; AddInBom: yes; OriginModelName: C 0603; Device: C; 联系售后，技术支持: https://shop463601444.taobao.com; 唯一出售店铺网址: https://shop463601444.taobao.com; DesignItemID: C; LibraryName: 0.1 - 电阻-电容-电感; SymbolName: C; FootprintName: C 0603_L
C174 = C: 贴片电容; BOM名称: 无极性贴片电容; 淘宝ID: 封装库来自淘宝 ID：黄晶宝石; Origin Footprint: C 0201_L; OriginFootprint 2: C 0402_L; OriginFootprint 3: C 0805_L; OriginFootprint 4: C 1206_L; OriginFootprint 5: C 1210_L; OriginFootprint 6: C 1808_L; OriginFootprint 7: C 1812_L; OriginFootprint 8: C 1825_L; OriginFootprint 9: C 2225_L; OriginFootprint 10: C 0201_M; OriginFootprint 11: C 0402_M; OriginFootprint 12: C 0603_M; OriginFootprint 13: C 0805_M; OriginFootprint 14: C 1206_M; OriginFootprint 15: C 1210_M; OriginFootprint 16: C 1808_M; OriginFootprint 17: C 1812_M; OriginFootprint 18: C 1825_M; OriginFootprint 19: C 2225_M; UniqueId: 3db1f6a400993974; AddInBom: yes; OriginModelName: C 0603; Device: C; 联系售后，技术支持: https://shop463601444.taobao.com; 唯一出售店铺网址: https://shop463601444.taobao.com; DesignItemID: C; LibraryName: 0.1 - 电阻-电容-电感; SymbolName: C; FootprintName: C 0603_L
C178 = eeufr1j221l: 容值:220uF;精度:±20%;额定电压:63V;纹波电流:1.5A@100kHz;等效串联电阻(ESR):33mΩ@100kHz;; Manufacturer: PANASONIC(松下); AddInBom: yes; ModelId: 6ce78ce5315348e095d700085da75e48; ModelName: CAP-TH_D10.0-H16.0-P5.00; ModelTransform: 394.094,393.72252,0,0,0,0,0,0,-137.795; Tolerance: ±20%; Voltage Rating: 63V; Pin Spacing: 5mm; Lifetime: 10000hrs@105℃; Symbol: EEUFR1J221L; LCSC Part Name: 220uF ±20% 63V; SupplierPart: C178712; ManufacturerPart: EEUFR1J221L; Supplier Footprint: 插件,D10xL25mm; JLCPCB Part Class: Extended Part; Datasheet: https://item.szlcsc.com/datasheet/EEUFR1J221L/190105.html; Supplier: LCSC; ConvertToPcb: yes; FootprintName: CAP-TH_BD10.0-P5.00-D1.0-FD; Value: 220uF; Ripple Current: 1.5A@100kHz; Equivalent Series Resistance(ESR): 33mΩ@100kHz; Diameter: 10mm; Height - Seated (Max): 25mm; Operating Temperature: -40℃~+105℃
C179 = grm21br71h105ka12l: 容值:1uF;精度:±10%;额定电压:50V;温度系数:X7R;; Manufacturer: muRata(村田); AddInBom: yes; ModelId: 1ba041120af144c991958decab20d241; ModelName: C0805_L2.0-W1.3-H1.3; ModelTransform: 78.74,51.181,0,0,0,0,0,0.0005,0; Tolerance: ±10%; Voltage Rating: 50V; Temperature Coefficient: X7R; Symbol: GRM21BR71H105KA12L; LCSC Part Name: 1uF ±10% 50V; SupplierPart: C77083; ManufacturerPart: GRM21BR71H105KA12L; Supplier Footprint: 0805; JLCPCB Part Class: Extended Part; Datasheet: https://item.szlcsc.com/datasheet/GRM21BR71H105KA12L/78210.html; Supplier: LCSC; ConvertToPcb: yes; FootprintName: C0805; Value: 1uF
C181 = C: 贴片电容; BOM名称: 无极性贴片电容; 淘宝ID: 封装库来自淘宝 ID：黄晶宝石; Origin Footprint: C 0201_L; OriginFootprint 2: C 0402_L; OriginFootprint 3: C 0805_L; OriginFootprint 4: C 1206_L; OriginFootprint 5: C 1210_L; OriginFootprint 6: C 1808_L; OriginFootprint 7: C 1812_L; OriginFootprint 8: C 1825_L; OriginFootprint 9: C 2225_L; OriginFootprint 10: C 0201_M; OriginFootprint 11: C 0402_M; OriginFootprint 12: C 0603_M; OriginFootprint 13: C 0805_M; OriginFootprint 14: C 1206_M; OriginFootprint 15: C 1210_M; OriginFootprint 16: C 1808_M; OriginFootprint 17: C 1812_M; OriginFootprint 18: C 1825_M; OriginFootprint 19: C 2225_M; UniqueId: e068690e94c157bc; AddInBom: yes; OriginModelName: C 0603; Device: C; 联系售后，技术支持: https://shop463601444.taobao.com; 唯一出售店铺网址: https://shop463601444.taobao.com; DesignItemID: C; LibraryName: 0.1 - 电阻-电容-电感; SymbolName: C; FootprintName: C 0603_L
C182 = C: 贴片电容; BOM名称: 无极性贴片电容; 淘宝ID: 封装库来自淘宝 ID：黄晶宝石; Origin Footprint: C 0201_L; OriginFootprint 2: C 0402_L; OriginFootprint 3: C 0805_L; OriginFootprint 4: C 1206_L; OriginFootprint 5: C 1210_L; OriginFootprint 6: C 1808_L; OriginFootprint 7: C 1812_L; OriginFootprint 8: C 1825_L; OriginFootprint 9: C 2225_L; OriginFootprint 10: C 0201_M; OriginFootprint 11: C 0402_M; OriginFootprint 12: C 0603_M; OriginFootprint 13: C 0805_M; OriginFootprint 14: C 1206_M; OriginFootprint 15: C 1210_M; OriginFootprint 16: C 1808_M; OriginFootprint 17: C 1812_M; OriginFootprint 18: C 1825_M; OriginFootprint 19: C 2225_M; UniqueId: 60b913fe2234996d; AddInBom: yes; OriginModelName: C 0603; Device: C; 联系售后，技术支持: https://shop463601444.taobao.com; 唯一出售店铺网址: https://shop463601444.taobao.com; DesignItemID: C; LibraryName: 0.1 - 电阻-电容-电感; SymbolName: C; FootprintName: C 0603_L
C183 = C: 贴片电容; BOM名称: 无极性贴片电容; 淘宝ID: 封装库来自淘宝 ID：黄晶宝石; Origin Footprint: C 0201_L; OriginFootprint 2: C 0402_L; OriginFootprint 3: C 0805_L; OriginFootprint 4: C 1206_L; OriginFootprint 5: C 1210_L; OriginFootprint 6: C 1808_L; OriginFootprint 7: C 1812_L; OriginFootprint 8: C 1825_L; OriginFootprint 9: C 2225_L; OriginFootprint 10: C 0201_M; OriginFootprint 11: C 0402_M; OriginFootprint 12: C 0603_M; OriginFootprint 13: C 0805_M; OriginFootprint 14: C 1206_M; OriginFootprint 15: C 1210_M; OriginFootprint 16: C 1808_M; OriginFootprint 17: C 1812_M; OriginFootprint 18: C 1825_M; OriginFootprint 19: C 2225_M; UniqueId: 09d5d64189419707; AddInBom: yes; OriginModelName: C 0603; Device: C; 联系售后，技术支持: https://shop463601444.taobao.com; 唯一出售店铺网址: https://shop463601444.taobao.com; DesignItemID: C; LibraryName: 0.1 - 电阻-电容-电感; SymbolName: C; FootprintName: C 0603_L
C184 = C: 贴片电容; BOM名称: 无极性贴片电容; 淘宝ID: 封装库来自淘宝 ID：黄晶宝石; Origin Footprint: C 0201_L; OriginFootprint 2: C 0402_L; OriginFootprint 3: C 0805_L; OriginFootprint 4: C 1206_L; OriginFootprint 5: C 1210_L; OriginFootprint 6: C 1808_L; OriginFootprint 7: C 1812_L; OriginFootprint 8: C 1825_L; OriginFootprint 9: C 2225_L; OriginFootprint 10: C 0201_M; OriginFootprint 11: C 0402_M; OriginFootprint 12: C 0603_M; OriginFootprint 13: C 0805_M; OriginFootprint 14: C 1206_M; OriginFootprint 15: C 1210_M; OriginFootprint 16: C 1808_M; OriginFootprint 17: C 1812_M; OriginFootprint 18: C 1825_M; OriginFootprint 19: C 2225_M; UniqueId: a4fa6dbd8546cc48; AddInBom: yes; OriginModelName: C 0603; Device: C; 联系售后，技术支持: https://shop463601444.taobao.com; 唯一出售店铺网址: https://shop463601444.taobao.com; DesignItemID: C; LibraryName: 0.1 - 电阻-电容-电感; SymbolName: C; FootprintName: C 0603_L
C185 = C: 贴片电容; BOM名称: 无极性贴片电容; 淘宝ID: 封装库来自淘宝 ID：黄晶宝石; Origin Footprint: C 0201_L; OriginFootprint 2: C 0402_L; OriginFootprint 3: C 0805_L; OriginFootprint 4: C 1206_L; OriginFootprint 5: C 1210_L; OriginFootprint 6: C 1808_L; OriginFootprint 7: C 1812_L; OriginFootprint 8: C 1825_L; OriginFootprint 9: C 2225_L; OriginFootprint 10: C 0201_M; OriginFootprint 11: C 0402_M; OriginFootprint 12: C 0603_M; OriginFootprint 13: C 0805_M; OriginFootprint 14: C 1206_M; OriginFootprint 15: C 1210_M; OriginFootprint 16: C 1808_M; OriginFootprint 17: C 1812_M; OriginFootprint 18: C 1825_M; OriginFootprint 19: C 2225_M; UniqueId: 5298304991856aac; AddInBom: yes; OriginModelName: C 0603; Device: C; 联系售后，技术支持: https://shop463601444.taobao.com; 唯一出售店铺网址: https://shop463601444.taobao.com; DesignItemID: C; LibraryName: 0.1 - 电阻-电容-电感; SymbolName: C; FootprintName: C 0603_L
C186 = C: 贴片电容; BOM名称: 无极性贴片电容; 淘宝ID: 封装库来自淘宝 ID：黄晶宝石; Origin Footprint: C 0201_L; OriginFootprint 2: C 0402_L; OriginFootprint 3: C 0805_L; OriginFootprint 4: C 1206_L; OriginFootprint 5: C 1210_L; OriginFootprint 6: C 1808_L; OriginFootprint 7: C 1812_L; OriginFootprint 8: C 1825_L; OriginFootprint 9: C 2225_L; OriginFootprint 10: C 0201_M; OriginFootprint 11: C 0402_M; OriginFootprint 12: C 0603_M; OriginFootprint 13: C 0805_M; OriginFootprint 14: C 1206_M; OriginFootprint 15: C 1210_M; OriginFootprint 16: C 1808_M; OriginFootprint 17: C 1812_M; OriginFootprint 18: C 1825_M; OriginFootprint 19: C 2225_M; UniqueId: cd91d26fa4917fbf; AddInBom: yes; OriginModelName: C 0603; Device: C; 联系售后，技术支持: https://shop463601444.taobao.com; 唯一出售店铺网址: https://shop463601444.taobao.com; DesignItemID: C; LibraryName: 0.1 - 电阻-电容-电感; SymbolName: C; FootprintName: C 0603_L
C187 = C: 贴片电容; BOM名称: 无极性贴片电容; 淘宝ID: 封装库来自淘宝 ID：黄晶宝石; Origin Footprint: C 0201_L; OriginFootprint 2: C 0402_L; OriginFootprint 3: C 0805_L; OriginFootprint 4: C 1206_L; OriginFootprint 5: C 1210_L; OriginFootprint 6: C 1808_L; OriginFootprint 7: C 1812_L; OriginFootprint 8: C 1825_L; OriginFootprint 9: C 2225_L; OriginFootprint 10: C 0201_M; OriginFootprint 11: C 0402_M; OriginFootprint 12: C 0603_M; OriginFootprint 13: C 0805_M; OriginFootprint 14: C 1206_M; OriginFootprint 15: C 1210_M; OriginFootprint 16: C 1808_M; OriginFootprint 17: C 1812_M; OriginFootprint 18: C 1825_M; OriginFootprint 19: C 2225_M; UniqueId: 485846f0059d8f41; AddInBom: yes; OriginModelName: C 0603; Device: C; 联系售后，技术支持: https://shop463601444.taobao.com; 唯一出售店铺网址: https://shop463601444.taobao.com; DesignItemID: C; LibraryName: 0.1 - 电阻-电容-电感; SymbolName: C; FootprintName: C 0603_L
C188 = C: 贴片电容; BOM名称: 无极性贴片电容; 淘宝ID: 封装库来自淘宝 ID：黄晶宝石; Origin Footprint: C 0201_L; OriginFootprint 2: C 0402_L; OriginFootprint 3: C 0805_L; OriginFootprint 4: C 1206_L; OriginFootprint 5: C 1210_L; OriginFootprint 6: C 1808_L; OriginFootprint 7: C 1812_L; OriginFootprint 8: C 1825_L; OriginFootprint 9: C 2225_L; OriginFootprint 10: C 0201_M; OriginFootprint 11: C 0402_M; OriginFootprint 12: C 0603_M; OriginFootprint 13: C 0805_M; OriginFootprint 14: C 1206_M; OriginFootprint 15: C 1210_M; OriginFootprint 16: C 1808_M; OriginFootprint 17: C 1812_M; OriginFootprint 18: C 1825_M; OriginFootprint 19: C 2225_M; UniqueId: 7c578440d25b8116; AddInBom: yes; OriginModelName: C 0603; Device: C; 联系售后，技术支持: https://shop463601444.taobao.com; 唯一出售店铺网址: https://shop463601444.taobao.com; DesignItemID: C; LibraryName: 0.1 - 电阻-电容-电感; SymbolName: C; FootprintName: C 0603_L
C189 = C: 贴片电容; BOM名称: 无极性贴片电容; 淘宝ID: 封装库来自淘宝 ID：黄晶宝石; Origin Footprint: C 0201_L; OriginFootprint 2: C 0402_L; OriginFootprint 3: C 0805_L; OriginFootprint 4: C 1206_L; OriginFootprint 5: C 1210_L; OriginFootprint 6: C 1808_L; OriginFootprint 7: C 1812_L; OriginFootprint 8: C 1825_L; OriginFootprint 9: C 2225_L; OriginFootprint 10: C 0201_M; OriginFootprint 11: C 0402_M; OriginFootprint 12: C 0603_M; OriginFootprint 13: C 0805_M; OriginFootprint 14: C 1206_M; OriginFootprint 15: C 1210_M; OriginFootprint 16: C 1808_M; OriginFootprint 17: C 1812_M; OriginFootprint 18: C 1825_M; OriginFootprint 19: C 2225_M; UniqueId: cc82bf2c2e22e605; AddInBom: yes; OriginModelName: C 0603; Device: C; 联系售后，技术支持: https://shop463601444.taobao.com; 唯一出售店铺网址: https://shop463601444.taobao.com; DesignItemID: C; LibraryName: 0.1 - 电阻-电容-电感; SymbolName: C; FootprintName: C 0603_L
C190 = C: 贴片电容; BOM名称: 无极性贴片电容; 淘宝ID: 封装库来自淘宝 ID：黄晶宝石; Origin Footprint: C 0201_L; OriginFootprint 2: C 0402_L; OriginFootprint 3: C 0805_L; OriginFootprint 4: C 1206_L; OriginFootprint 5: C 1210_L; OriginFootprint 6: C 1808_L; OriginFootprint 7: C 1812_L; OriginFootprint 8: C 1825_L; OriginFootprint 9: C 2225_L; OriginFootprint 10: C 0201_M; OriginFootprint 11: C 0402_M; OriginFootprint 12: C 0603_M; OriginFootprint 13: C 0805_M; OriginFootprint 14: C 1206_M; OriginFootprint 15: C 1210_M; OriginFootprint 16: C 1808_M; OriginFootprint 17: C 1812_M; OriginFootprint 18: C 1825_M; OriginFootprint 19: C 2225_M; UniqueId: ab4a8fe24fad9fe4; AddInBom: yes; OriginModelName: C 0603; Device: C; 联系售后，技术支持: https://shop463601444.taobao.com; 唯一出售店铺网址: https://shop463601444.taobao.com; DesignItemID: C; LibraryName: 0.1 - 电阻-电容-电感; SymbolName: C; FootprintName: C 0603_L
C191 = C: 贴片电容; BOM名称: 无极性贴片电容; 淘宝ID: 封装库来自淘宝 ID：黄晶宝石; Origin Footprint: C 0201_L; OriginFootprint 2: C 0402_L; OriginFootprint 3: C 0805_L; OriginFootprint 4: C 1206_L; OriginFootprint 5: C 1210_L; OriginFootprint 6: C 1808_L; OriginFootprint 7: C 1812_L; OriginFootprint 8: C 1825_L; OriginFootprint 9: C 2225_L; OriginFootprint 10: C 0201_M; OriginFootprint 11: C 0402_M; OriginFootprint 12: C 0603_M; OriginFootprint 13: C 0805_M; OriginFootprint 14: C 1206_M; OriginFootprint 15: C 1210_M; OriginFootprint 16: C 1808_M; OriginFootprint 17: C 1812_M; OriginFootprint 18: C 1825_M; OriginFootprint 19: C 2225_M; UniqueId: 9b91e7356bb9865f; AddInBom: yes; OriginModelName: C 0603; Device: C; 联系售后，技术支持: https://shop463601444.taobao.com; 唯一出售店铺网址: https://shop463601444.taobao.com; DesignItemID: C; LibraryName: 0.1 - 电阻-电容-电感; SymbolName: C; FootprintName: C 0603_L
C192 = C: 贴片电容; BOM名称: 无极性贴片电容; 淘宝ID: 封装库来自淘宝 ID：黄晶宝石; Origin Footprint: C 0201_L; OriginFootprint 2: C 0402_L; OriginFootprint 3: C 0805_L; OriginFootprint 4: C 1206_L; OriginFootprint 5: C 1210_L; OriginFootprint 6: C 1808_L; OriginFootprint 7: C 1812_L; OriginFootprint 8: C 1825_L; OriginFootprint 9: C 2225_L; OriginFootprint 10: C 0201_M; OriginFootprint 11: C 0402_M; OriginFootprint 12: C 0603_M; OriginFootprint 13: C 0805_M; OriginFootprint 14: C 1206_M; OriginFootprint 15: C 1210_M; OriginFootprint 16: C 1808_M; OriginFootprint 17: C 1812_M; OriginFootprint 18: C 1825_M; OriginFootprint 19: C 2225_M; UniqueId: 4b556904310d1556; AddInBom: yes; OriginModelName: C 0603; Device: C; 联系售后，技术支持: https://shop463601444.taobao.com; 唯一出售店铺网址: https://shop463601444.taobao.com; DesignItemID: C; LibraryName: 0.1 - 电阻-电容-电感; SymbolName: C; FootprintName: C 0603_L
C193 = C: 贴片电容; BOM名称: 无极性贴片电容; 淘宝ID: 封装库来自淘宝 ID：黄晶宝石; Origin Footprint: C 0201_L; OriginFootprint 2: C 0402_L; OriginFootprint 3: C 0805_L; OriginFootprint 4: C 1206_L; OriginFootprint 5: C 1210_L; OriginFootprint 6: C 1808_L; OriginFootprint 7: C 1812_L; OriginFootprint 8: C 1825_L; OriginFootprint 9: C 2225_L; OriginFootprint 10: C 0201_M; OriginFootprint 11: C 0402_M; OriginFootprint 12: C 0603_M; OriginFootprint 13: C 0805_M; OriginFootprint 14: C 1206_M; OriginFootprint 15: C 1210_M; OriginFootprint 16: C 1808_M; OriginFootprint 17: C 1812_M; OriginFootprint 18: C 1825_M; OriginFootprint 19: C 2225_M; UniqueId: af7046427a4bfdfb; AddInBom: yes; OriginModelName: C 0603; Device: C; 联系售后，技术支持: https://shop463601444.taobao.com; 唯一出售店铺网址: https://shop463601444.taobao.com; DesignItemID: C; LibraryName: 0.1 - 电阻-电容-电感; SymbolName: C; FootprintName: C 0603_L
C194 = C: 贴片电容; BOM名称: 无极性贴片电容; 淘宝ID: 封装库来自淘宝 ID：黄晶宝石; Origin Footprint: C 0201_L; OriginFootprint 2: C 0402_L; OriginFootprint 3: C 0805_L; OriginFootprint 4: C 1206_L; OriginFootprint 5: C 1210_L; OriginFootprint 6: C 1808_L; OriginFootprint 7: C 1812_L; OriginFootprint 8: C 1825_L; OriginFootprint 9: C 2225_L; OriginFootprint 10: C 0201_M; OriginFootprint 11: C 0402_M; OriginFootprint 12: C 0603_M; OriginFootprint 13: C 0805_M; OriginFootprint 14: C 1206_M; OriginFootprint 15: C 1210_M; OriginFootprint 16: C 1808_M; OriginFootprint 17: C 1812_M; OriginFootprint 18: C 1825_M; OriginFootprint 19: C 2225_M; UniqueId: 65328433fb04ddb7; AddInBom: yes; OriginModelName: C 0603; Device: C; 联系售后，技术支持: https://shop463601444.taobao.com; 唯一出售店铺网址: https://shop463601444.taobao.com; DesignItemID: C; LibraryName: 0.1 - 电阻-电容-电感; SymbolName: C; FootprintName: C 0603_L
C195 = C: 贴片电容; BOM名称: 无极性贴片电容; 淘宝ID: 封装库来自淘宝 ID：黄晶宝石; Origin Footprint: C 0201_L; OriginFootprint 2: C 0402_L; OriginFootprint 3: C 0805_L; OriginFootprint 4: C 1206_L; OriginFootprint 5: C 1210_L; OriginFootprint 6: C 1808_L; OriginFootprint 7: C 1812_L; OriginFootprint 8: C 1825_L; OriginFootprint 9: C 2225_L; OriginFootprint 10: C 0201_M; OriginFootprint 11: C 0402_M; OriginFootprint 12: C 0603_M; OriginFootprint 13: C 0805_M; OriginFootprint 14: C 1206_M; OriginFootprint 15: C 1210_M; OriginFootprint 16: C 1808_M; OriginFootprint 17: C 1812_M; OriginFootprint 18: C 1825_M; OriginFootprint 19: C 2225_M; UniqueId: deb55bbe20a101cf; AddInBom: yes; OriginModelName: C 0603; Device: C; 联系售后，技术支持: https://shop463601444.taobao.com; 唯一出售店铺网址: https://shop463601444.taobao.com; DesignItemID: C; LibraryName: 0.1 - 电阻-电容-电感; SymbolName: C; FootprintName: C 0603_L
C196 = C: 贴片电容; BOM名称: 无极性贴片电容; 淘宝ID: 封装库来自淘宝 ID：黄晶宝石; Origin Footprint: C 0201_L; OriginFootprint 2: C 0402_L; OriginFootprint 3: C 0805_L; OriginFootprint 4: C 1206_L; OriginFootprint 5: C 1210_L; OriginFootprint 6: C 1808_L; OriginFootprint 7: C 1812_L; OriginFootprint 8: C 1825_L; OriginFootprint 9: C 2225_L; OriginFootprint 10: C 0201_M; OriginFootprint 11: C 0402_M; OriginFootprint 12: C 0603_M; OriginFootprint 13: C 0805_M; OriginFootprint 14: C 1206_M; OriginFootprint 15: C 1210_M; OriginFootprint 16: C 1808_M; OriginFootprint 17: C 1812_M; OriginFootprint 18: C 1825_M; OriginFootprint 19: C 2225_M; UniqueId: 6827ca7a6bd67e26; AddInBom: yes; OriginModelName: C 0603; Device: C; 联系售后，技术支持: https://shop463601444.taobao.com; 唯一出售店铺网址: https://shop463601444.taobao.com; DesignItemID: C; LibraryName: 0.1 - 电阻-电容-电感; SymbolName: C; FootprintName: C 0603_L
CON1 CON3 = CON50A_0: Manufacturer: 连科; Remark: 0.5mm 50P B2B 3.5mm合高 母头; Manufacturer PartNumber: NLWBS05-50C-2.2H
  CON1: ComponentLink1Description: New link; ComponentLink1URL: *; Parameter 1: *
CON2 CON4 = CON50A_0: Manufacturer: 连科; Manufacturer PartNumber: NLWBP05-50C-1.3H; Remark: 0.5mm 50P B2B 3.5mm合高 公头
CON5 = Header 2: 2P接插件; 版权归属: 封装库来自淘宝卖家 ID：黄晶宝石; BOM名称: 2P接插件; 学习资源: https://shop463601444.taobao.com
D1 D8 = smbj33a_c224019: 极性:单向;反向截止电压(Vrwm):33V;钳位电压:53.3V;峰值脉冲电流(Ipp):11.3A@10/1000us;峰值脉冲功率(Ppp):600W@10/1000us;击穿电压:40.6V;; Manufacturer: Littelfuse(美国力特); AddInBom: yes; ModelId: 5e8926c661484ff2a35b83e5ae62aeb9; ModelTransform: 212.598,141.732,0,0,0,0,0,0,0; Polarity: 单向; Reverse Stand-Off Voltage (Vrwm): 33V; Clamping Voltage: 53.3V; Voltage - Breakdown: 40.6V; Reverse Leakage Current (Ir): 1uA; level of protection: IEC 61000-4-4；IEC 61000-4-2; Type: TVS; Symbol: SMBJ33A_C224019; LCSC Part Name: SMBJ33A; SupplierPart: C224019; ManufacturerPart: SMBJ33A; Supplier Footprint: SMB(DO-214AA); JLCPCB Part Class: Extended Part; Datasheet: https://item.szlcsc.com/datasheet/SMBJ33A/224167.html; Supplier: LCSC; ConvertToPcb: yes; FootprintName: SMB_L4.6-W3.6-LS5.3-RD; ModelName: SMB_L4.6-W3.6-LS5.3-RD; Peak Pulse Current (Ipp): 11.3A@10/1000us; Peak Pulse Power Dissipation (Ppp): 600W@10/1000us; Operating Temperature: -65℃~+150℃
D2 D4 = 1n4148w_c7420318: 二极管配置:独立式;整流电流:150mA;直流反向耐压(Vr):100V;正向压降(Vf):1.25V@150mA;反向恢复时间(Trr):4ns;; Manufacturer: R+O(宏嘉诚); AddInBom: yes; ModelId: 5054d9b7be8b429dad093a54b517b4dd; ModelTransform: 145.669,61.024,0,0,0,0,0,0,0; Diode Configuration: 独立式; Pd - Power Dissipation: 400mW; Current - Rectified: 150mA; Voltage - DC Reverse(Vr): 100V; Non-Repetitive Peak Forward Surge Current: 2A; Reverse Leakage Current (Ir): 1uA@75V; Reverse Recovery Time (trr): 4ns; Operating Junction Temperature Range: -55℃~+150℃; Symbol: 1N4148W_C7420318; LCSC Part Name: 100V 150mA; SupplierPart: C7420318; ManufacturerPart: 1N4148W; Supplier Footprint: SOD-123; JLCPCB Part Class: Extended Part; Datasheet: https://item.szlcsc.com/datasheet/1N4148W/8397140.html; Supplier: LCSC; ConvertToPcb: yes; FootprintName: SOD-123_L2.7-W1.6-LS3.7-FD; ModelName: SOD-123_L2.7-W1.6-LS3.7-FD; Voltage - Forward(Vf@If): 1.25V@150mA
D3 = pesd2can,215: 极性:双向;反向截止电压(Vrwm):24V;钳位电压:41V;峰值脉冲电流(Ipp):5A@8/20us;峰值脉冲功率(Ppp):230W@8/20us;击穿电压:28V;; Manufacturer: Nexperia(安世); AddInBom: yes; ModelId: c62791f0466c4ae2a892c056b845b0ca; ModelName: SOT-23-3P_L2.9-W1.3-H1.0-LS2.4-P0.95; ModelTransform: 98.425,114.173,0,180,0,0,0.0005,-0.0005,0; Polarity: 双向; Reverse Stand-Off Voltage (Vrwm): 24V; Clamping Voltage: 41V; Voltage - Breakdown: 28V; Reverse Leakage Current (Ir): 1nA; Number of Channels: 双路; level of protection: IEC 61000-4-5；IEC 61000-4-2; Type: ESD; Junction Capacitance: 25pF; Symbol: PESD2CAN,215; LCSC Part Name: 双向ESD 24V截止 峰值脉冲电流：5A@8/20us; SupplierPart: C75176; ManufacturerPart: PESD2CAN,215; Supplier Footprint: SOT-23; JLCPCB Part Class: Extended Part; Datasheet: https://item.szlcsc.com/datasheet/PESD2CAN%252C215/76300.html; Supplier: LCSC; ConvertToPcb: yes; FootprintName: SOT-23-3_L2.9-W1.3-P1.90-LS2.4-BR; Peak Pulse Current (Ipp): 5A@8/20us; Peak Pulse Power Dissipation (Ppp): 230W@8/20us; Operating Temperature: -55℃~+150℃@(Ta)
D5 = tpd4e1u06dbvr: 极性:单向;反向截止电压(Vrwm):5.5V;钳位电压:15V;峰值脉冲电流(Ipp):3A@8/20us;峰值脉冲功率(Ppp):45W@8/20us;击穿电压:8.5V;; Manufacturer: TI(德州仪器); AddInBom: yes; ModelId: 18da8f6c14a34920b3e136b5c401a119; ModelName: SOT-23-6_L2.9-W1.6-H1.5-LS2.8-P0.95; ModelTransform: 110.73671,114.173,0,180,0,0,0.001,-0.003,0; Polarity: 单向; Reverse Stand-Off Voltage (Vrwm): 5.5V; Clamping Voltage: 15V; Voltage - Breakdown: 8.5V; Reverse Leakage Current (Ir): 10nA; Number of Channels: 四路; level of protection: IEC 61000-4-4；IEC 61000-4-5；IEC 61000-4-2; Type: TVS; Junction Capacitance: 0.8pF; Symbol: TPD4E1U06DBVR; LCSC Part Name: 单向ESD; SupplierPart: C124691; ManufacturerPart: TPD4E1U06DBVR; Supplier Footprint: SOT-23-6; JLCPCB Part Class: Extended Part; Datasheet: https://www.ti.com/cn/lit/gpn/tpd4e1u06; Supplier: LCSC; ConvertToPcb: yes; FootprintName: SOT-23-6_L2.9-W1.6-P0.95-LS2.8-BR; Peak Pulse Current (Ipp): 3A@8/20us; Peak Pulse Power Dissipation (Ppp): 45W@8/20us; Operating Temperature: -40℃~+125℃
D6 = b560c-13-f: 二极管配置:1个独立式;正向压降(Vf):700mV@5A;直流反向耐压(Vr):60V;整流电流:5A;; Manufacturer: DIODES(美台); AddInBom: yes; ModelId: 01527a4a3c424c5dbce25e8907f4d20c; ModelTransform: 314.96,236.22,0,0,0,0,0,0,0; Diode Configuration: 1个独立式; Voltage - DC Reverse(Vr): 60V; Current - Rectified: 5A; Reverse Leakage Current (Ir): 500uA@60V; Operating Junction Temperature Range: -55℃~+150℃; Non-Repetitive Peak Forward Surge Current: 100A; Symbol: B560C-13-F; LCSC Part Name: 电压:60V 电流:5A; SupplierPart: C85100; ManufacturerPart: B560C-13-F; Supplier Footprint: SMC(DO-214AB); JLCPCB Part Class: Extended Part; Datasheet: https://item.szlcsc.com/datasheet/B560C-13-F/86272.html; Supplier: LCSC; ConvertToPcb: yes; FootprintName: SMC_L7.1-W6.2-LS8.1-RD; ModelName: SMC_L7.1-W6.2-LS8.1-RD; Voltage - Forward(Vf@If): 700mV@5A